# Altium schematic sheet IO-Extender.SchDoc
size A4; SheetNumber: 2; SheetTotal: 6
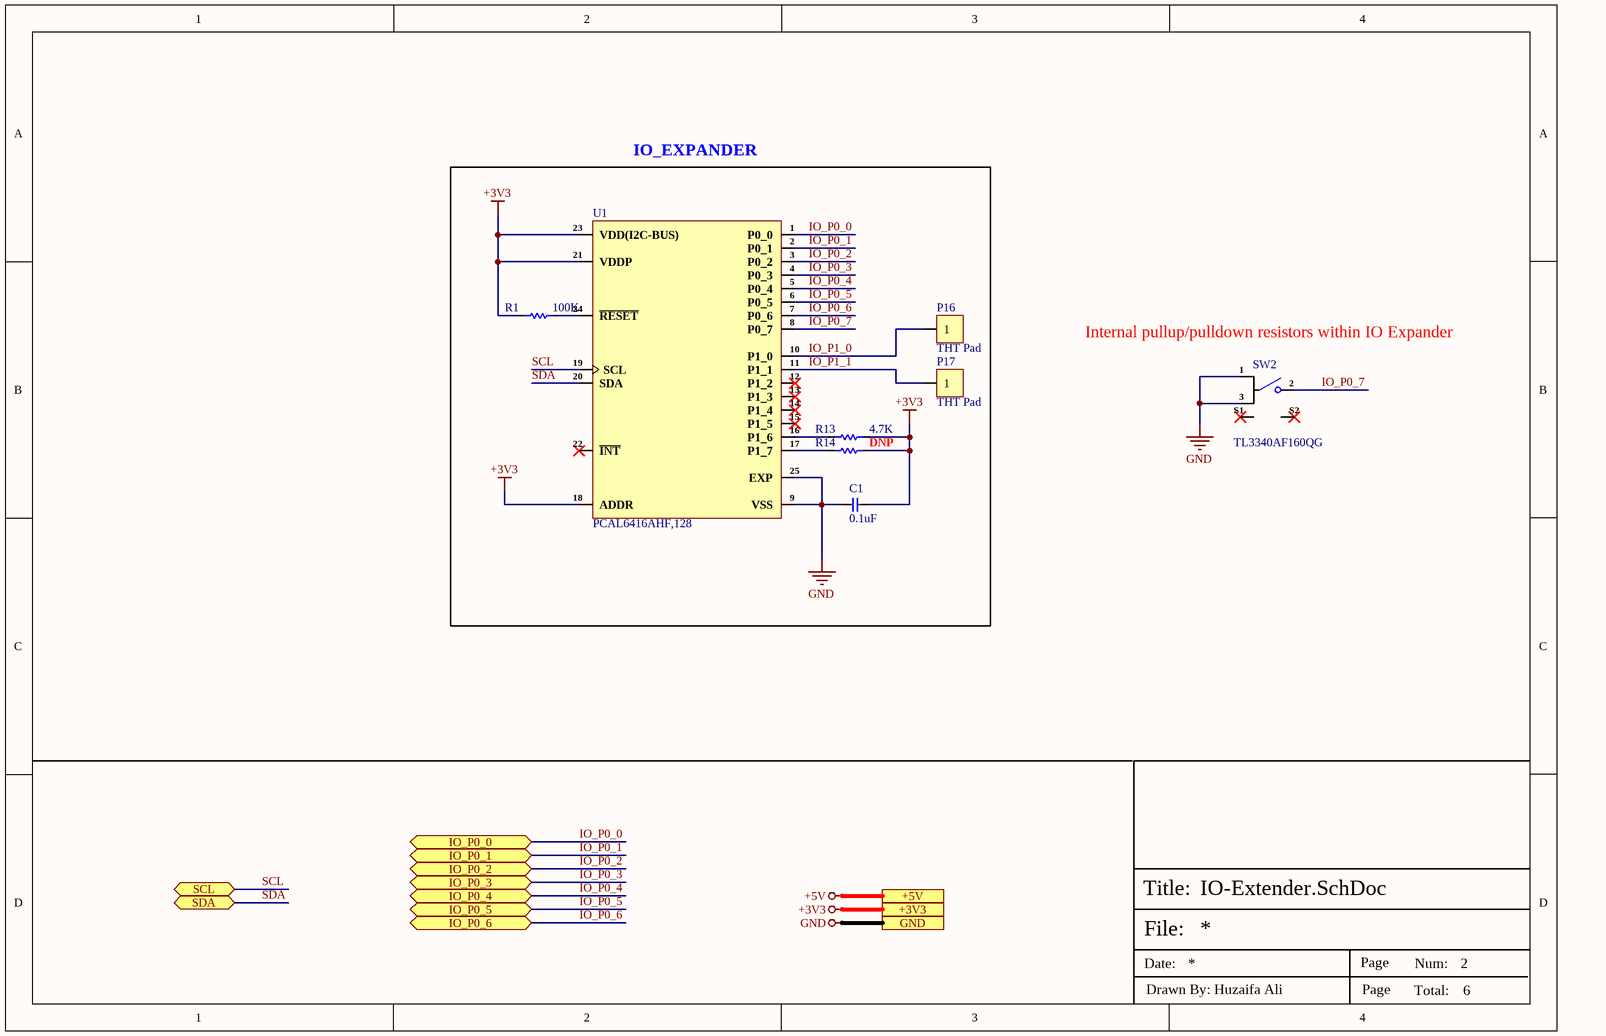
[diagram p0: IO-Extender.SchDoc]

## Parts
C1  0.1uF  [Cap-0603]
P16  THT Pad  [TH-0.75/0.6]  (no BOM)
P17  THT Pad  [TH-0.75/0.6]  (no BOM)
R1  100K  [Res-0603]
R13  4.7K  [Res-0603]
R14  DNP  [Res-0603]
SW2  TL3340AF160QG  [TL3340AF160QG]
U1  PCAL6416AHF,128  [QFN-24-EP(4x4)]

## Blocks framed on the sheet
IO_EXPANDER: C1 P16 P17 R1 R13 R14 U1

## Ports
+3V3 (see Top-Sheet[2B], Connection Powermodule[2D], HMI Part[3D]), +5V (see Top-Sheet[2B], Connection Powermodule[2D], MOSFET Driving[2D], Pad Connections[3D]), GND (see Top-Sheet[2B], Connection Powermodule[2D], HMI Part[3D], MOSFET Driving[2D], Pad Connections[3D]), IO_P0_0 (bidir, see Top-Sheet[3C], Pad Connections[1D]), IO_P0_1 (bidir, see Top-Sheet[2B], MOSFET Driving[1D]), IO_P0_2 (bidir, see Top-Sheet[2B], MOSFET Driving[1D]), IO_P0_3 (bidir, see Top-Sheet[2B], HMI Part[1D]), IO_P0_4 (bidir, see Top-Sheet[2B], HMI Part[1D]), IO_P0_5 (bidir, see Top-Sheet[2B], HMI Part[1D]), IO_P0_6 (bidir, see Top-Sheet[2B], HMI Part[1D]), SCL (bidir, see Top-Sheet[3B], Connection Powermodule[1D], Pad Connections[1D]), SDA (bidir, see Top-Sheet[3B], Connection Powermodule[1D], Pad Connections[1D])

## Nets
+3V3: C1.2 R1.2 R13.2 R14.2 U1.18(ADDR) U1.21(VDDP) U1.23(VDD(I2C-BUS)) ; port +3V3
+5V: port +5V
GND: C1.1 SW2.1(COM_1) SW2.3(COM_2) U1.9(VSS) U1.25(EXP) ; port GND
IO_P0_0: U1.1(P0_0) ; port IO_P0_0
IO_P0_1: U1.2(P0_1) ; port IO_P0_1
IO_P0_2: U1.3(P0_2) ; port IO_P0_2
IO_P0_3: U1.4(P0_3) ; port IO_P0_3
IO_P0_4: U1.5(P0_4) ; port IO_P0_4
IO_P0_5: U1.6(P0_5) ; port IO_P0_5
IO_P0_6: U1.7(P0_6) ; port IO_P0_6
IO_P0_7: SW2.2(NO) U1.8(P0_7)
IO_P1_0: P16.1 U1.10(P1_0)
IO_P1_1: P17.1 U1.11(P1_1)
SCL: U1.19(SCL) ; port SCL
SDA: U1.20(SDA) ; port SDA
NetR1_1: R1.1 U1.24(~{RESET})
NetR13_1: R13.1 U1.16(P1_6)
NetR14_1: R14.1 U1.17(P1_7)

Not connected (* = marked no-connect by the designer): SW2 S1(GND)* S2(GND)*; U1 12(P1_2)* 13(P1_3)* 14(P1_4)* 15(P1_5)* 22(~{INT})*

## Notes on the sheet
- (near SW2) Internal pullup/pulldown resistors within IO Expander
- File:
- Title:
- Date:
- Page
- Num:
- Total:
- Drawn By: Huzaifa Ali

## Library data of the parts
C1 = CC0603KRX7R0BB104: CAP CER 0.1UF 100V X7R 0603; Manufacturer: Yageo; Capacitance: 100nF; Tolerance: 10%; Item Type: Capacitor; Supplier 1: Digi-Key; Manufacturer Part Number: CC0603KRX7R0BB104; RoHS: Yes; Category: Ceramic Capacitors; Stock 1: 60476; Pricing 1: 1=0.19000, 10=0.13500, 50=0.07680, 100=0.06370, 500=0.04466, 1000=0.03696 (USD); Mount: Surface Mount; Case/Package: 0603; Case Code (Metric): 1608; Case Code (Imperial): 0603; Weight: 7.1E-05oz; Min Operating Temperature: -55°C; Max Operating Temperature: 125°C; Package Quantity: 4000; Voltage Rating: 100V; Packaging: Tape and Reel; Dielectric: X7R; Termination: SMD/SMT; Resistor Type: Ceramic; Voltage Rating (DC): 100V; Series: CC; Length: 0.063inch; Width: 0.031inch; Thickness: 0.035inch; Depth: 0.8mm; Lead Free: Lead Free; RoHS Compliant: Yes; ComponentLink1URL: https://datasheet.ciiva.com/6277/mlccorderingcode-6277030.pdf?src-supplier=Digi-Key; ComponentLink1Description: https://datasheet.ciiva.com/6277/mlccorderingcode-6277030.pdf?src-supplier=Digi-Key; ComponentLink2URL: https://datasheet.ciiva.com/6277/mlccorderingcode-6277081.pdf?src-supplier=Digi-Key; ComponentLink2Description: https://datasheet.ciiva.com/6277/mlccorderingcode-6277081.pdf?src-supplier=Digi-Key; ComponentLink3URL: https://datasheet.ciiva.com/6277/mlccorderingcode-6277082.pdf?src-supplier=Digi-Key; ComponentLink3Description: https://datasheet.ciiva.com/6277/mlccorderingcode-6277082.pdf?src-supplier=Digi-Key; Supplier Part Number 1: 311-1523-1-ND; LCSC Part Number: C113803
P16 P17 = TH-0.75/0.6
R1 = RC0603JR-07100KL: RES 100K OHM 5% 1/10W 0603; Manufacturer: Yageo; Resistance: 100kR; Temperature Coefficient: 100ppm/°C; Voltage Rating: 50V; Power Rating: 100mW; Item Type: Resistor; Supplier 1: Digi-Key; Manufacturer Part Number: RC0603JR-07100KL; RoHS: Yes; Category: Chip SMD Resistors; Stock 1: 1210037; Pricing 1: 1=0.10000, 10=0.02000, 100=0.00800, 1000=0.00360, 2500=0.00312 (USD); Case/Package: 0603; Number of Pins: 2; Contact Plating: Tin,Matte; Case Code (Imperial): 0603; Case Code (Metric): 1608; Size Code: 0603; Min Operating Temperature: -55°C; Max Operating Temperature: 155°C; Tolerance: 5%; Resistor Type: Thick Film; Packaging: Tape and Reel; Voltage Rating (DC): 50V; Termination: SMD/SMT; Features: Moisture Resistant; Series: RC; Max Power Dissipation: 100mW; Number of Terminations: 2; Resistance Tolerance: 5%; Width: 0.8mm; Radiation Hardening: No; REACH SVHC: No SVHC; Lead Free: Lead Free; RoHS Compliant: Yes; ComponentLink1URL: https://datasheet.ciiva.com/7746/443971-7746424.pdf?src-supplier=Element14; ComponentLink1Description: https://datasheet.ciiva.com/7746/443971-7746424.pdf?src-supplier=Element14; ComponentLink2URL: https://datasheet.ciiva.com/7983/443971-7983686.pdf?src-supplier=Element14; ComponentLink2Description: https://datasheet.ciiva.com/7983/443971-7983686.pdf?src-supplier=Element14; ComponentLink3URL: https://datasheet.ciiva.com/7746/443971-7746423.pdf?src-supplier=Element14; ComponentLink3Description: https://datasheet.ciiva.com/7746/443971-7746423.pdf?src-supplier=Element14; ComponentLink4URL: https://datasheet.ciiva.com/8887/pyu-rc0603-51-rohs-l-4-8887903.pdf?src-supplier=Avnet; ComponentLink4Description: https://datasheet.ciiva.com/8887/pyu-rc0603-51-rohs-l-4-8887903.pdf?src-supplier=Avnet; Supplier Part Number 1: 311-100KGRCT-ND; LCSC Part Number: C100048
R13 = RC0603FR-074K7L: RES SMD 4.7K OHM 1% 1/10W 0603; Manufacturer: Yageo; Item Type: Resistor; Manufacturer Part Number: RC0603FR-074K7L; Package: 0603; ComponentLink7Description: LCSC; ComponentLink7URL: https://www.lcsc.com/product-detail/Chip-Resistor-Surface-Mount_YAGEO-RC0603FR-074K7L_C99782.html; LCSC Part Number: C99782
R14 = DNP: Item Type: Resistor; Package: 0603; ComponentLink1Description: LCSC
SW2 = TL3340AF160QG: Switch Tactile N.O. SPST Round Button Gull Wing 0.05A 12VDC 100000Cycles 1.57N SMD; Manufacturer: E-Switch; Actuator Material: Polyphthalamide; Number of Positions: 2NUMBER; Contact Current Rating: 50mA; Operating Force: 160gf; Voltage Rating (DC): 12V; Contact Resistance: 500mR; Illumination Type: Non-Illuminated,Illuminated; Switch Travel: 0.2mm; Switch Function: Off-Mom; Actuator Type: Standard; Actuator Length: 0.85mm; Supplier: Future Electronics; Supplier Part Number: 9232661; Manufacturer Part Number: TL3340AF160QG; RoHS: Yes; Category: Tactile Switches; Stock: 16000; Pricing: 2000=0.27 (USD); Mounting Technology: Surface Mount; Case/Package: SMD/SMT; Contact Material: Stainless Steel,Silver; Contact Plating: Stainless Steel,Silver; Color: White; Mechanical Life: 100000Cycles; Housing Material: Polyphthalamide; Min Operating Temperature: -35°C; Max Operating Temperature: 85°C; Throw Configuration: SPST; Package Quantity: 1; Packaging: Tape and Reel; Current Rating: 50mA; Max Voltage Rating (DC): 12V; Termination: Gull Wing; Electrical Life: 100000Cycles; Orientation: Right Angle; Series: TL3340; Height: 3.55mm; Size: 3.3mm; Reach SVHC Compliant: No; Lead Free: 5697LeadFree; RoHS Compliant: Yes; ComponentLink1URL: https://datasheet.ciiva.com/7637/tl3340-7637667.pdf?src-supplier=Element14; ComponentLink1Description: https://datasheet.ciiva.com/7637/tl3340-7637667.pdf?src-supplier=Element14; ComponentLink2URL: https://datasheet.ciiva.com/5284/tl3340-28153-5284108.pdf?src-supplier=Mouser; ComponentLink2Description: https://datasheet.ciiva.com/5284/tl3340-28153-5284108.pdf?src-supplier=Mouser; ComponentLink3URL: https://datasheet.ciiva.com/2900/p021301b-2900825.pdf?src-supplier=Digikey; ComponentLink3Description: https://datasheet.ciiva.com/2900/p021301b-2900825.pdf?src-supplier=Digikey; ComponentLink4URL: https://datasheet.ciiva.com/2900/p021301b-2900826.pdf?src-supplier=Digikey; ComponentLink4Description: https://datasheet.ciiva.com/2900/p021301b-2900826.pdf?src-supplier=Digikey; ComponentLink5URL: https://datasheet.ciiva.com/2900/p021301b-2900827.pdf?src-supplier=Digikey; ComponentLink5Description: https://datasheet.ciiva.com/2900/p021301b-2900827.pdf?src-supplier=Digikey
U1 = PCAL6416AHF,128: IC XPND 400KHZ I2C SMBUS 24HWQFN; Manufacturer: NXP Semiconductors; Min Supply Voltage: 1.65V; Max Supply Voltage: 5.5V; Output Current: 25mA; Number of I/Os: 16; Clock Frequency: 100kHz; Nominal Supply Current: 1.1mA; Supplier: Avnet; Supplier Part Number: 75X0096; Manufacturer Part Number: PCAL6416AHF,128; RoHS: Yes; Category: Interface ICs; Stock: 5086; Pricing: 1=1.23, 10=1.05, 25=0.969, 50=0.887 (USD); Mounting Technology: Surface Mount; Pins: 24; Min Operating Temperature: -40°C; Max Operating Temperature: 85°C; Packaging: Tape and Reel; Package Quantity: 1; Interface: I2C; Frequency: 400kHz; Series: -; Height: 800um; Reach SVHC Compliant: No; Lead Free: Lead Free; RoHS Compliant: Yes; ComponentLink1URL: https://datasheet.ciiva.com/46433/1845292-46433847.pdf?src-supplier=Element14; ComponentLink1Description: https://datasheet.ciiva.com/46433/1845292-46433847.pdf?src-supplier=Element14; ComponentLink2URL: https://datasheet.ciiva.com/6633/pcal6416a-6633094.pdf?src-supplier=Digikey; ComponentLink2Description: https://datasheet.ciiva.com/6633/pcal6416a-6633094.pdf?src-supplier=Digikey; ComponentLink3URL: https://datasheet.ciiva.com/6633/pcal6416a-6633096.pdf?src-supplier=Digikey; ComponentLink3Description: https://datasheet.ciiva.com/6633/pcal6416a-6633096.pdf?src-supplier=Digikey; LCSC Part Number: C2652287; Item Type: IC